# EAGLE design av-streamer-audio-hat (EAGLE 9.7.0)
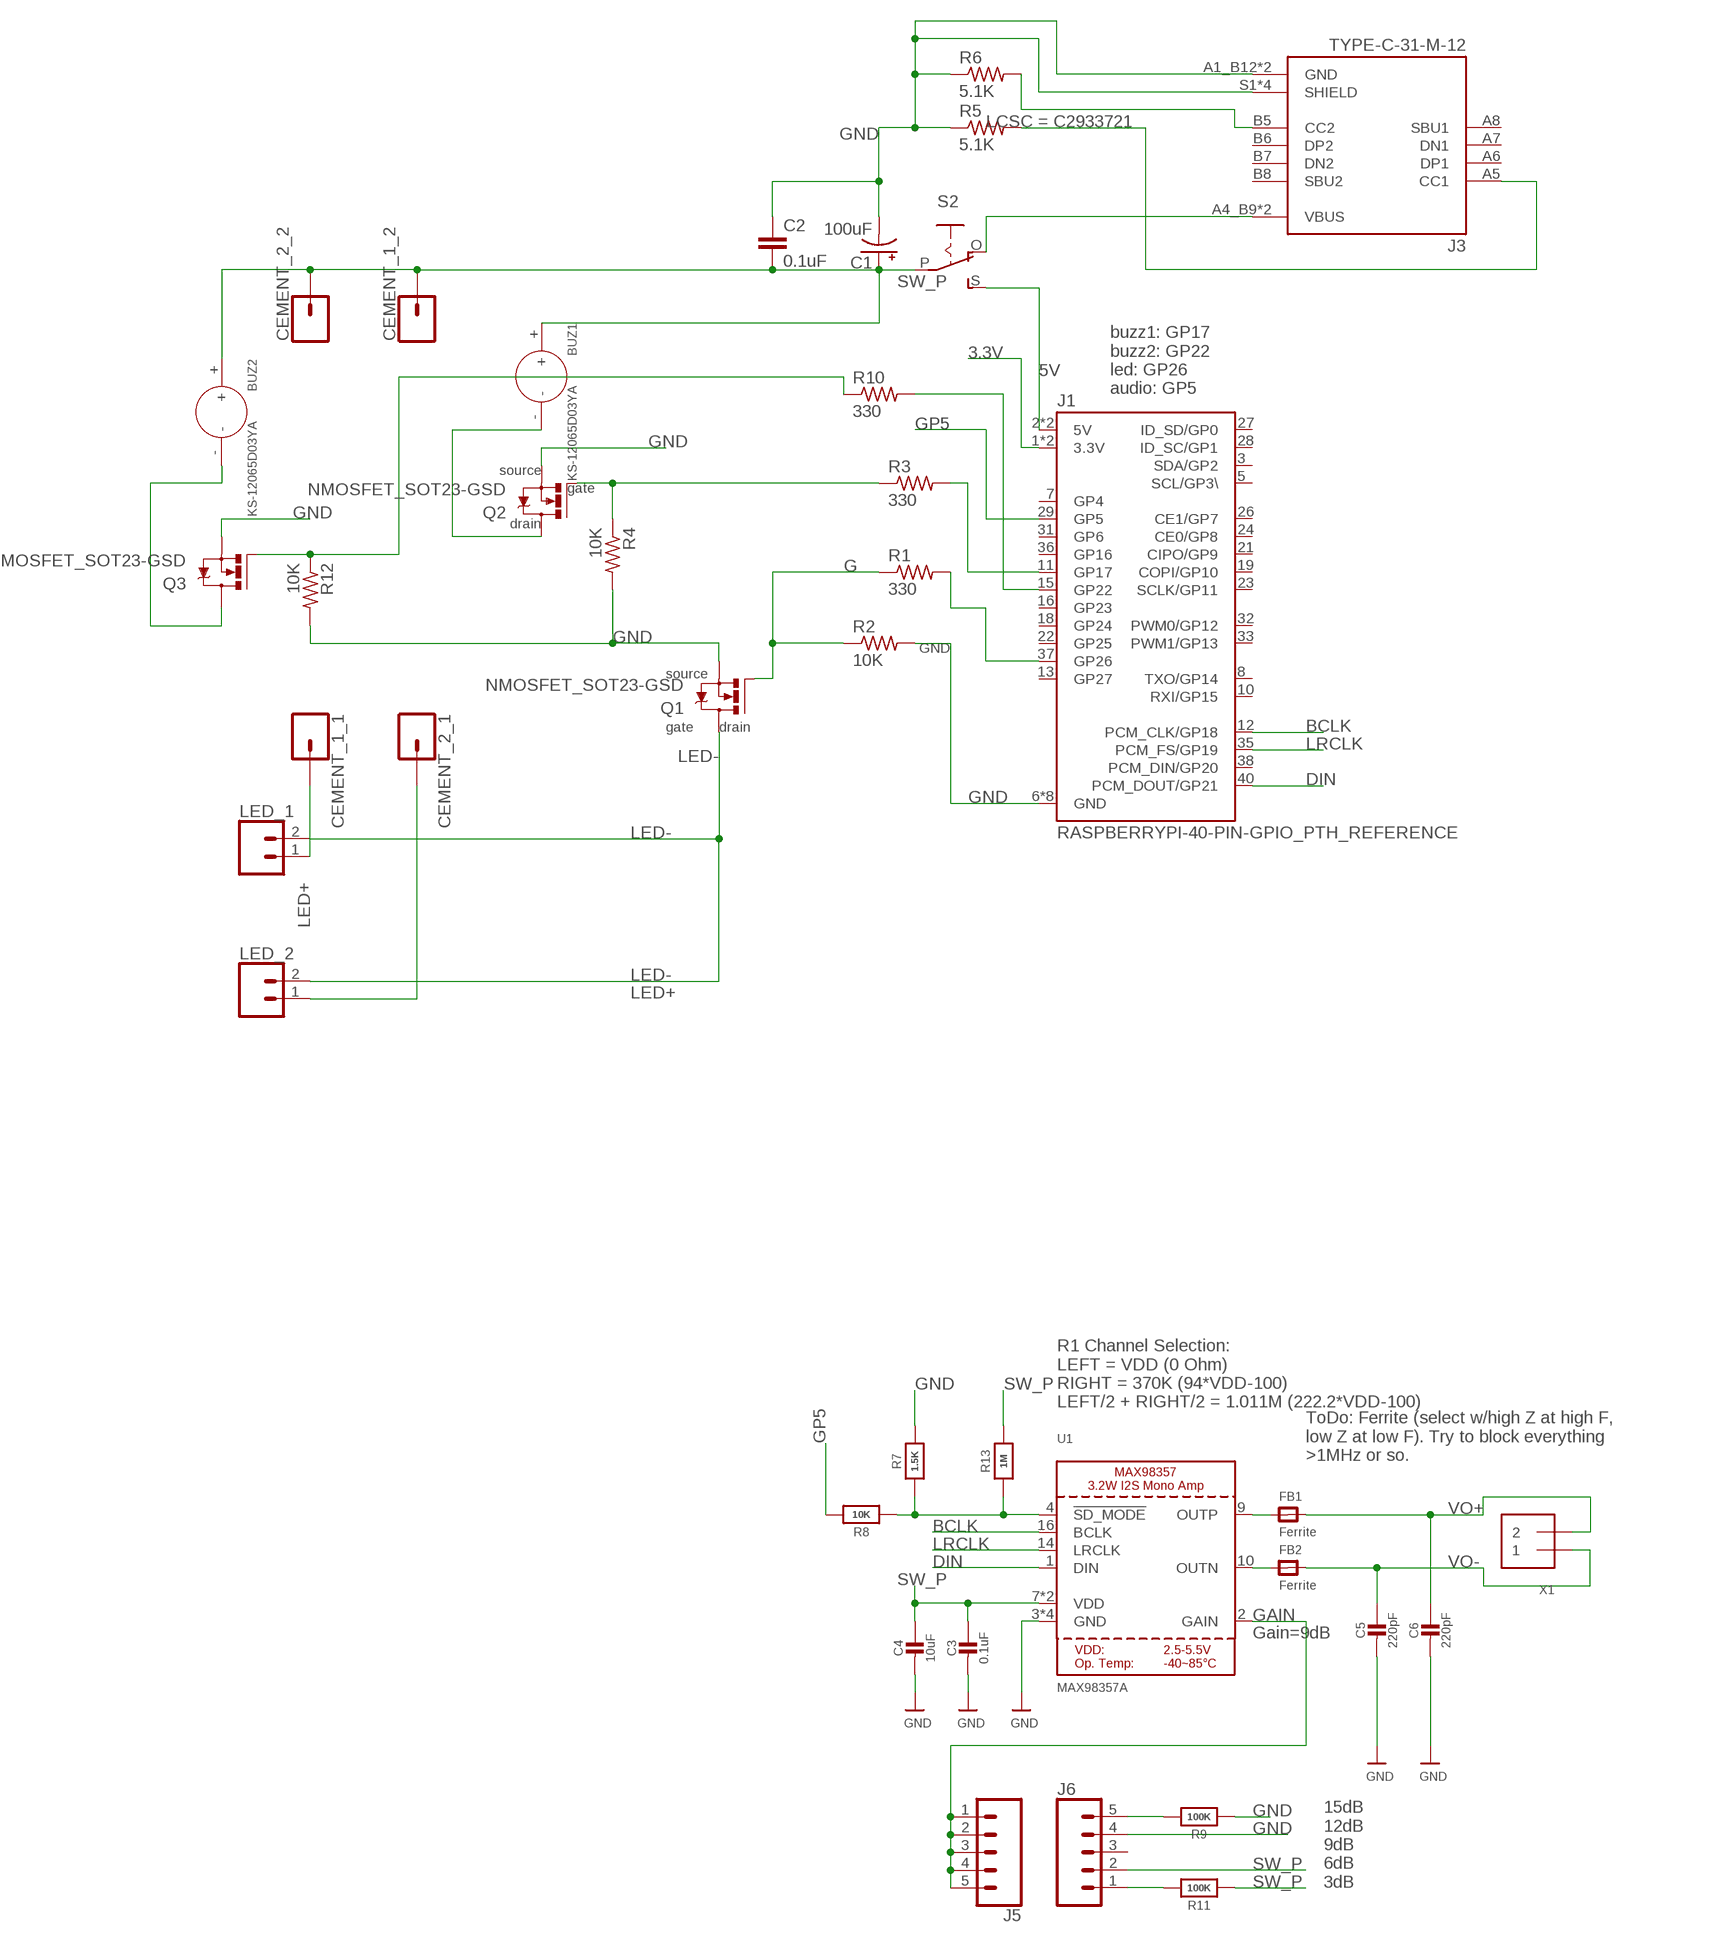
[diagram p0: schematic, sheet 1]

## Parts
BUZ1  KS-12065D03YA  DIP-BUZZER-3V(KS-12065D03YA)  [BZ2-7.6-D12.0XH6.5MM]
BUZ2  KS-12065D03YA  DIP-BUZZER-3V(KS-12065D03YA)  [BZ2-7.6-D12.0XH6.5MM]
C1  100uF  100UF-POLAR-EIA7343-10V-10%(TANT)  [EIA7343]
C2  0.1uF  0.1UF-0402-16V-10%  [0402]
C3  0.1uF  CAP_CERAMIC0805-NOOUTLINE  [0805-NO]
C4  10uF  CAP_CERAMIC0805-NOOUTLINE  [0805-NO]
C5  220pF  CAP_CERAMIC0805-NOOUTLINE  [0805-NO]
C6  220pF  CAP_CERAMIC0805-NOOUTLINE  [0805-NO]
CEMENT_1_1  CONN_01  [1X01]
CEMENT_1_2  CONN_01  [1X01]
CEMENT_2_1  CONN_01  [1X01]
CEMENT_2_2  CONN_01  [1X01]
FB1  Ferrite  FERRITE-0805NO  [0805-NO]
FB2  Ferrite  FERRITE-0805NO  [0805-NO]
J1  RASPBERRYPI-40-PIN-GPIO_PTH_REFERENCE  [RASPBERRY_PI_HAT_40_PIN_PTH_WITH_REFERNCE]
J3  TYPE-C-31-M-12  [HRO_TYPE-C-31-M-12]
J5  CONN_05PTH  [1X05]
J6  CONN_05PTH  [1X05]
LED_1  CONN_02  [1X02]
LED_2  CONN_02  [1X02]
Q1  NMOSFET_SOT23-GSD  [SOT23]
Q2  NMOSFET_SOT23-GSD  [SOT23]
Q3  NMOSFET_SOT23-GSD  [SOT23]
R1  330  R-US_R1206  [R1206]
R2  10K  R-US_R1206  [R1206]
R3  330  R-US_R1206  [R1206]
R4  10K  R-US_R1206  [R1206]
R5  5.1K  R-US_R1206  [R1206]
R6  5.1K  R-US_R1206  [R1206]
R7  1.5K  RESISTOR0805_NOOUTLINE  [0805-NO]
R8  10K  RESISTOR0805_NOOUTLINE  [0805-NO]
R9  100K  RESISTOR0805_NOOUTLINE  [0805-NO]
R10  330  R-US_R1206  [R1206]
R11  100K  RESISTOR0805_NOOUTLINE  [0805-NO]
R12  10K  R-US_R1206  [R1206]
R13  1M  RESISTOR0805_NOOUTLINE  [0805-NO]
S2  EG1218S  [EG1218]
U1  MAX98357A  AUDIOAMP_MAX98357  [QFN16_3MM]
X1  TERMBLOCK_1X2  [TERMBLOCK_1X2-3.5MM]

## Nets
3.3V: J1.1(3.3V) J1.17(3.3V)
5V [POWER]: J1.2(5V) J1.4(5V) S2.S
BCLK [SIG]: J1.12(PCM_CLK/GP18) U1.16(BCLK)
DIN [SIG]: J1.40(PCM_DOUT/GP21) U1.1(DIN)
G [LED]: Q1.1(G) R1.1 R2.1
GAIN [SIG]: J5.1 J5.2 J5.3 J5.4 J5.5 U1.2(GAIN)
GND: C1.C(-) C2.1 C3.2 C4.2 C5.2 C6.2 J1.6(GND) J1.9(GND) J1.14(GND) J1.20(GND) J1.25(GND) J1.30(GND) J1.34(GND) J1.39(GND) J3.A1_B12(GND) J3.B1_A12(GND) J3.S1(SHIELD) J3.S2(SHIELD) J3.S3(SHIELD) J3.S4(SHIELD) J6.4 Q1.2(S) Q2.2(S) Q3.2(S) R2.2 R4.2 R5.1 R6.1 R7.2 R9.1 R12.2 U1.3(GND) U1.11(GND) U1.15(GND) U1.THERMAL(GND)
GP5 [SIG]: J1.29(GP5) R8.2
GP16: J1.15(GP22) R10.2
LED+ [LED]: CEMENT_1_1.1 CEMENT_2_1.1 LED_1.1 LED_2.1
LED- [LED]: LED_1.2 LED_2.2 Q1.3(D)
LRCLK [SIG]: J1.35(PCM_FS/GP19) U1.14(LRCLK)
N$1: J1.11(GP17) R3.2
N$2: FB2.1 U1.10(OUTN)
N$3 [SIG]: J1.37(GP26) R1.2
N$4: Q2.1(G) R3.1 R4.1
N$5: J3.A5(CC1) R5.2
N$6: J3.B5(CC2) R6.2
N$7: J3.A4_B9(VBUS) J3.B4_A9(VBUS) S2.O
N$8: BUZ2.- Q3.3(D)
N$9 [POWER]: BUZ1.- Q2.3(D)
N$11: FB1.1 U1.9(OUTP)
N$12: Q3.1(G) R10.1 R12.1
N$13: J6.5 R9.2
N$14 [SIG]: R7.1 R8.1 R13.1 U1.4(!SD_MODE)
N$15: J6.1 R11.2
SW_P [POWER]: BUZ1.+ BUZ2.+ C1.A(+) C2.2 C3.1 C4.1 CEMENT_1_2.1 CEMENT_2_2.1 J6.2 R11.1 R13.2 S2.P U1.7(VDD) U1.8(VDD)
VO+: C6.1 FB1.2 X1.2
VO-: C5.1 FB2.2 X1.1
Unconnected: J1.3(SDA/GP2) J1.5(SCL/GP3\) J1.7(GP4) J1.8(TXO/GP14) J1.10(RXI/GP15) J1.13(GP27) J1.16(GP23) J1.18(GP24) J1.19(COPI/GP10) J1.21(CIPO/GP9) J1.22(GP25) J1.23(SCLK/GP11) J1.24(CE0/GP8) J1.26(CE1/GP7) J1.27(ID_SD/GP0) J1.28(ID_SC/GP1) J1.31(GP6) J1.32(PWM0/GP12) J1.33(PWM1/GP13) J1.36(GP16) J1.38(PCM_DIN/GP20) J3.A6(DP1) J3.A7(DN1) J3.A8(SBU1) J3.B6(DP2) J3.B7(DN2) J3.B8(SBU2) J6.3

## Notes on the sheet
- buzz1: GP17
  buzz2: GP22
  led: GP26
  audio: GP5
- source
- gate
- drain
- source
- gate | drain
- R1 Channel Selection:
  LEFT = VDD (0 Ohm)
  RIGHT = 370K (94*VDD-100)
  LEFT/2 + RIGHT/2 = 1.011M (222.2*VDD-100)
- ToDo: Ferrite (select w/high Z at high F,
  low Z at low F). Try to block everything
  >1MHz or so.
- Gain=9dB
- 15dB
  12dB
  9dB
  6dB
  3dB

## Library data of the parts
BUZ1 BUZ2 = OPL_Connector:DIP-BUZZER-3V(KS-12065D03YA): 312010004; MPN: KS-12065D03YA
C1 = SparkFun-Capacitors:100UF-POLAR: 100µF polarized capacitors A capacitor is a passive two-terminal electrical component used to store electrical energy temporarily in an electric field.; PROD_ID: CAP-07890
C2 = SparkFun-Capacitors:0.1UF: 0.1µF ceramic capacitors A capacitor is a passive two-terminal electrical component used to store electrical energy temporarily in an electric field.; PROD_ID: CAP-12416
C3-C6 = microbuilder:CAP_CERAMIC: Ceramic Capacitors For new designs, use the packages preceded by an '_' character since they are more reliable: The following footprints should be used on most boards: _0402 - Standard footprint for regular board layouts _0603 - Standard footprint for regular board layouts _0805 - Standard footprint for regular board layouts _1206 - Standard footprint for regular board layouts For extremely tight-pitch boards where space is at a premium, the following 'micro-pitch' footprints can be used (smaller pads, no silkscreen outline, etc.): _0402MP - Micro-pitch footprint for very dense/compact boards _0603MP - Micro-pitch footprint for very dense/compact boards _0805MP - Micro-pitch footprint for very dense/compact boards _1206MP - Micro-pitch footprint for very dense/compact boards
CEMENT_1_1 CEMENT_1_2 CEMENT_2_1 CEMENT_2_2 = SparkFun-Connectors:CONN_01: Single connection point. Often used as Generic Header-pin footprint for 0.1 inch spaced/style header connections On any of the 0.1 inch spaced packages, you can populate with these: Break Away Headers - Straight <https://www.sparkfun.com/products/116> (PRT-00116) Break Away Male Headers - Right Angle <https://www.sparkfun.com/products/553> (PRT-00553) Female Headers <https://www.sparkfun.com/products/115> (PRT-00115) Break Away Headers - Machine Pin <https://www.sparkfun.com/products/117> (PRT-00117) Break Away Female Headers - Swiss Machine Pin <https://www.sparkfun.com/products/743> (PRT-00743) This device is also useful as a general connection point to wire up your design to another part of your project. Our various solder wires solder well into these plated through hole pads. Hook-Up Wire - Assortment (Stranded, 22 AWG) <https://www.sparkfun.com/products/11375> (PRT-11375) Hook-Up Wire - Assortment (Solid Core, 22 AWG) <https://www.sparkfun.com/products/11367> (PRT-11367) View the entire wire category on our website here <https://www.sparkfun.com/categories/141> Special notes: SMTSO-256-ET is a "flush mount" nut for a 4-40 screw. We mostly use this on specialty testbeds; it is a nice way to connect hardware to your PCB at an adjustable hieght. Also note, the SNAP packages are for using a snappable style connector. We sell a baggie of snaps and they are also used on two LilyPad designs: Snap Assortment - 30 pack (male and female) <https://www.sparkfun.com/products/11347> (DEV-11347) LilyPad Arduino SimpleSnap <https://www.sparkfun.com/products/10941> (DEV-10941) LilyPad SimpleSnap Protoboard <https://www.sparkfun.com/products/10940> (DEV-10940)
FB1 FB2 = microbuilder:FERRITE: Ferrite Bead 0603 MMZ1608B121C - 120 Ohm @ 100MHz, 600mA, 0.15 Ohm DC Resistance - Digikey: 445-2164-1-ND BK1608HW121-T - 120 Ohm, 600mA Ferrite Chip - Digikey: 587-1876-2-ND 0805 HZ0805B272R-10 - 2.7K Ohm @ 100MHz, 200mA, 0.8 Ohm DC Resistance - Digikey: 240-2504-1-ND (see also Murata BLM21BD272SN1L) MMZ2012Y152B - 1.5K Ohm @ 100MHz, 500mA, 0.4 Ohm DC Resistance - Digikey: 445-1560-1-ND - Mainly for high frequency (80-400MHz) MMZ2012R102A - 1K Ohm @ 100MHz, 500mA, 0.3 Ohm DC Resistance - Digikey: 445-1555-2-ND - More general purpose (10-200MHz)
J1 = SparkFun-Connectors:RASPBERRYPI-40-PIN-GPIO: Raspberry Pi GPIO Header 2x20 pin connector, as found on B, B+, A+ models. Both shrouded PTH and SMT versions available. SparkFun Products: GPIO Shrouded Header <https://www.sparkfun.com/products/13054>- PTH SparkFun Pi Wedge (Preassembled) <https://www.sparkfun.com/products/13717>
J3 = TYPE-C-31-M-12:TYPE-C-31-M-12: Check availability <https://pricing.snapeda.com/parts/TYPE-C-31-M-12/HRO%20Electronics%20Co.%2C%20Ltd./view-part?ref=eda>; AVAILABILITY: Not in stock; CHECK_PRICES: https://www.snapeda.com/parts/TYPE-C-31-M-12/HRO+Electronics+Co.%252C+Ltd./view-part/?ref=eda; DESCRIPTION: USB Connectors 24 Receptacle 1 8.94*7.3mm RoHS; MF: HRO Electronics Co., Ltd.; MP: TYPE-C-31-M-12; PACKAGE: Package; PRICE: None; SNAPEDA_LINK: https://www.snapeda.com/parts/TYPE-C-31-M-12/HRO+Electronics+Co.%252C+Ltd./view-part/?ref=snap
J5 J6 = SparkFun-Connectors:CONN_05: Multi connection point. Often used as Generic Header-pin footprint for 0.1 inch spaced/style header connections On any of the 0.1 inch spaced packages, you can populate with these: Break Away Headers - Straight <https://www.sparkfun.com/products/116> (PRT-00116) Break Away Male Headers - Right Angle <https://www.sparkfun.com/products/553> (PRT-00553) Female Headers <https://www.sparkfun.com/products/115> (PRT-00115) Break Away Headers - Machine Pin <https://www.sparkfun.com/products/117> (PRT-00117) Break Away Female Headers - Swiss Machine Pin <https://www.sparkfun.com/products/743> (PRT-00743) For SCREWTERMINALS and SPRING TERMINALS visit here: Screw Terimnals on SparkFun.com <https://www.sparkfun.com/search/results?term=Screw+Terminals> (5mm/3.5mm/2.54mm spacing) This device is also useful as a general connection point to wire up your design to another part of your project. Our various solder wires solder well into these plated through hole pads. Hook-Up Wire - Assortment (Stranded, 22 AWG) <https://www.sparkfun.com/products/11375> (PRT-11375) Hook-Up Wire - Assortment (Solid Core, 22 AWG) <https://www.sparkfun.com/products/11367> (PRT-11367) View the entire wire category on our website here <https://www.sparkfun.com/categories/141> Special notes: Molex polarized connector foot print use with SKU : PRT-08231 with associated crimp pins and housings. 1MM SMD Version SKU: PRT-10208
LED_1 LED_2 = SparkFun-Connectors:CONN_02: Multi connection point. Often used as Generic Header-pin footprint for 0.1 inch spaced/style header connections On any of the 0.1 inch spaced packages, you can populate with these: Break Away Headers - Straight <https://www.sparkfun.com/products/116> (PRT-00116) Break Away Male Headers - Right Angle <https://www.sparkfun.com/products/553> (PRT-00553) Female Headers <https://www.sparkfun.com/products/115> (PRT-00115) Break Away Headers - Machine Pin <https://www.sparkfun.com/products/117> (PRT-00117) Break Away Female Headers - Swiss Machine Pin <https://www.sparkfun.com/products/743> (PRT-00743) For SCREWTERMINALS and SPRING TERMINALS visit here: Screw Terimnals on SparkFun.com <https://www.sparkfun.com/search/results?term=Screw+Terminals> (5mm/3.5mm/2.54mm spacing) This device is also useful as a general connection point to wire up your design to another part of your project. Our various solder wires solder well into these plated through hole pads. Hook-Up Wire - Assortment (Stranded, 22 AWG) <https://www.sparkfun.com/products/11375> (PRT-11375) Hook-Up Wire - Assortment (Solid Core, 22 AWG) <https://www.sparkfun.com/products/11367> (PRT-11367) View the entire wire category on our website here <https://www.sparkfun.com/categories/141> Special notes: Molex polarized connector foot print use with: PRT-08233 with associated crimp pins and housings. 2.54_SCREWTERM for use with PRT-10571. 3.5mm Screw Terminal footprints for PRT-08084 5mm Screw Terminal footprints for use with PRT-08432
Q1 = Transistor:NMOSFET: N-Channel MOSFET - Generic; CATEGORY: Transistor; DATASHEET: https://www.analog.com/media/en/package-pcb-resources/package/pkg_pdf/ltc-legacy-sot-23/sot3%2005-08-1631%20rev%20d.pdf; DESCRIPTION: Generic N Channel MOSFET SOT23-GSD Package Surface Mount; LCSC: C181090; PACKAGE_SIZE: SOT23; PACKAGE_TYPE: Surface Mount; SUBCATEGORY: MOSFET; TYPE: N-Channel
Q2 Q3 = Transistor:NMOSFET: N-Channel MOSFET - Generic; CATEGORY: Transistor; DATASHEET: https://www.analog.com/media/en/package-pcb-resources/package/pkg_pdf/ltc-legacy-sot-23/sot3%2005-08-1631%20rev%20d.pdf; DESCRIPTION: Generic N Channel MOSFET SOT23-GSD Package Surface Mount; PACKAGE_SIZE: SOT23; PACKAGE_TYPE: Surface Mount; SUBCATEGORY: MOSFET; TYPE: N-Channel
R1-R4 R10 R12 = adafruit:R-US_: RESISTOR, American symbol
R5 R6 = adafruit:R-US_: RESISTOR, American symbol; LCSC: C2933721
R7-R9 R11 R13 = microbuilder:RESISTOR: Resistors For new designs, use the packages preceded by an '_' character since they are more reliable: The following footprints should be used on most boards: _0402 - Standard footprint for regular board layouts _0603 - Standard footprint for regular board layouts _0805 - Standard footprint for regular board layouts _1206 - Standard footprint for regular board layouts For extremely tight-pitch boards where space is at a premium, the following 'micro-pitch' footprints can be used (smaller pads, no silkscreen outline, etc.): _0402MP - Micro-pitch footprint for very dense/compact boards _0603MP - Micro-pitch footprint for very dense/compact boards _0805MP - Micro-pitch footprint for very dense/compact boards _1206MP - Micro-pitch footprint for very dense/compact boards
S2 = adafruit:EG1218: SLIDING SWITCH 0.1" spacing through hole, vertical SPDT slide switch http://www.ladyada.net/library/pcb/eaglelibrary.html
U1 = microbuilder:AUDIOAMP_MAX98357: MAX98357 - 3.2W I2S Mono Audio Amp
X1 = microbuilder:TERMBLOCK_1X2: 3.5mm Terminal block http://www.ladyada.net/library/pcb/eaglelibrary.html

## Net classes
1 POWER: width 1 mm, clearance 0.3 mm
2 LED: width 1 mm, clearance 0.3 mm
3 SIG: width 0.254 mm

## Board
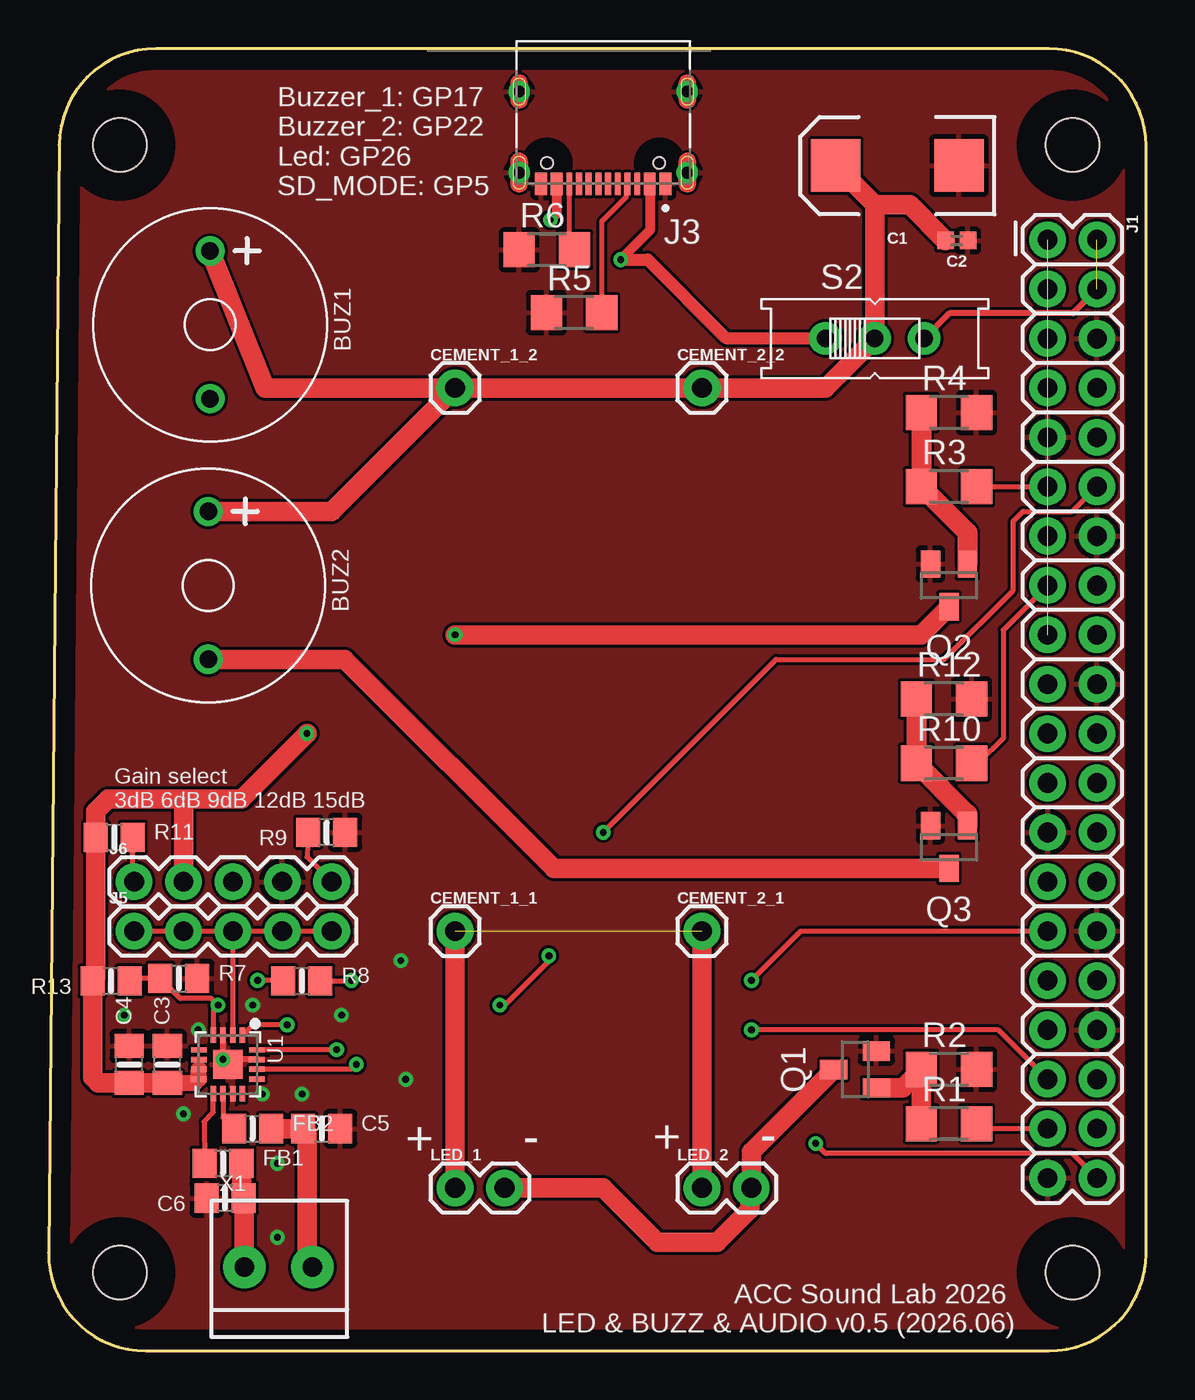
[diagram p1: board, top side]
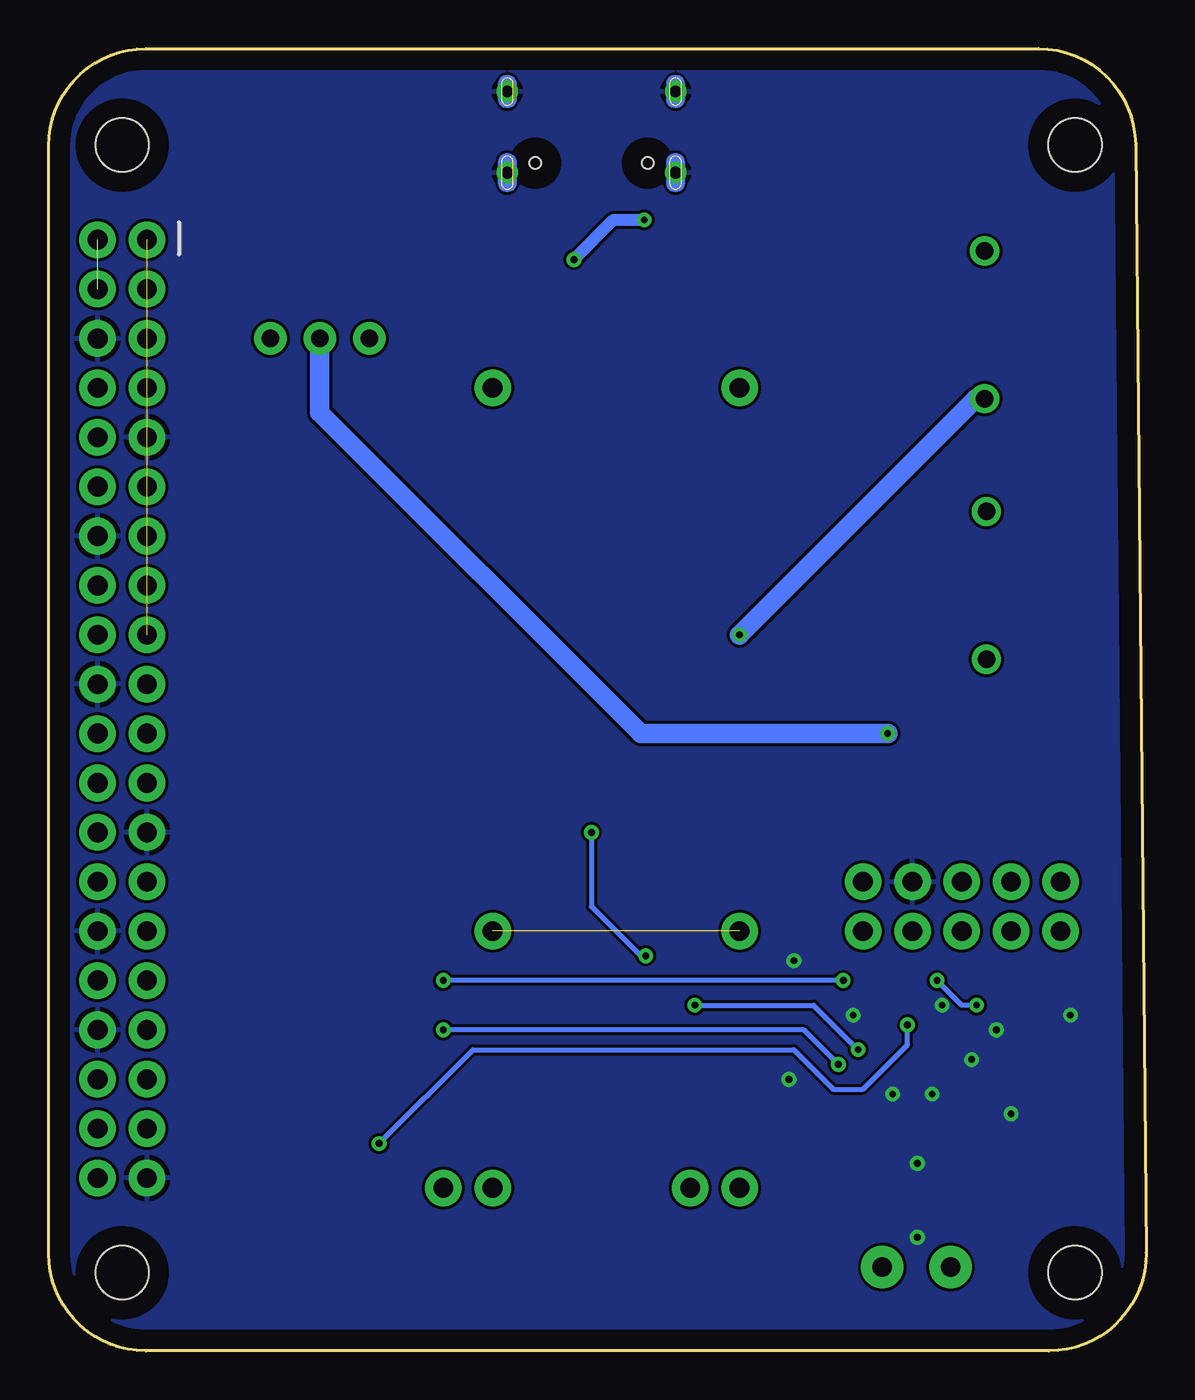
[diagram p2: board, bottom side, seen from below]

Size 56.45 x 66.98 mm. Coordinates in mm from the lower left corner, seen from the top.
Outline: 51.45,0 arc90 56.45,5 56.45,61.98 arc90 51.45,66.98 5.54,66.98 arc89 0.54,62.03 0,5.05 arc91 5,0 51.45,0
Copper layers (1*16): Top 0.035mm / dielectric 1.5mm / Bottom 0.035mm
Design rules "Fusion Electronics Design Rules": minimum track width 6mil, minimum drill 0.35mm, track to track 6mil, track to pad 6mil, pad to pad 6mil, via to via 6mil, smd to smd 6mil, copper to edge 40mil, drill to drill 6mil, minimum pad ring 10mil, minimum via ring 8mil, stop-mask expansion 4mil, vias tented up to drill 9999mil, thermal gap 10mil

### Footprints (pad centres in the part's own frame; a part is rotated, then mirrored left to right if it is on the bottom)
BZ2-7.6-D12.0XH6.5MM = drill 0.9 pad 1.5: + -3.8,0; - 3.8,0
EIA7343 = smd 2.55 x 2.7: A 3.17,0; C -3.17,0
0402 = smd 0.85 x 0.9: 1 -0.58,0; 2 0.58,0
0805-NO = smd 1.24 x 1.5: 1 -0.95,0; 2 0.95,0
1X01 = drill 1.016 pad 1.88: 1 0,0
RASPBERRY_PI_HAT_40_PIN_PTH_WITH_REFERNCE = drill 1.016 pad 1.88: 1 0,0; 2 0,2.54; 3 2.54,0; 4 2.54,2.54; 5 5.08,0; 6 5.08,2.54; 7 7.62,0; 8 7.62,2.54; 9 10.16,0; 10 10.16,2.54; 11 12.7,0; 12 12.7,2.54; 13 15.24,0; 14 15.24,2.54; 15 17.78,0; 16 17.78,2.54; 17 20.32,0; 18 20.32,2.54; 19 22.86,0; 20 22.86,2.54; 21 25.4,0; 22 25.4,2.54; 23 27.94,0; 24 27.94,2.54; 25 30.48,0; 26 30.48,2.54; 27 33.02,0; 28 33.02,2.54; 29 35.56,0; 30 35.56,2.54; 31 38.1,0; 32 38.1,2.54; 33 40.64,0; 34 40.64,2.54; 35 43.18,0; 36 43.18,2.54; 37 45.72,0; 38 45.72,2.54; 39 48.26,0; 40 48.26,2.54 | hole 2.75: -4.87,-47.727; 53.13,-47.727; 53.13,1.273; -4.87,1.273
HRO_TYPE-C-31-M-12 = smd 0.6 x 1.14: A1_B12 -3.2,4.75; A4_B9 -2.4,4.75; B1_A12 3.2,4.75; B4_A9 2.4,4.75 | smd 0.3 x 1.14: A5 -1.25,4.75; A6 -0.25,4.75; A7 0.25,4.75; A8 1.25,4.75; B5 1.75,4.75; B6 0.75,4.75; B7 -0.75,4.75; B8 -1.75,4.75 | drill 0.6 pad 0.9: S1 -4.325,4.17; S2 4.325,4.17; S3 -4.325,0; S4 4.325,0 | hole 0.6: -2.89,3.68; 2.89,3.68
1X05 = drill 1.016 pad 1.88: 1 0,0; 2 2.54,0; 3 5.08,0; 4 7.62,0; 5 10.16,0
1X02 = drill 1.016 pad 1.88: 1 0,0; 2 2.54,0
SOT23 = smd 1 x 1.4: 1 -0.95,-1.1; 2 0.95,-1.1; 3 0,1.1
R1206 = smd 1.6 x 1.803: 1 -1.422,0; 2 1.422,0
EG1218 = drill 0.9 pad 1.676: O -2.54,0; P 0,0; S 2.54,0
QFN16_3MM = smd 0.8 x 0.28: 1 -1.5,0.75; 2 -1.5,0.25; 3 -1.5,-0.25; 4 -1.5,-0.75; 9 1.5,-0.75; 10 1.5,-0.25; 11 1.5,0.25; 12 1.5,0.75 | smd 0.28 x 0.8: 5 -0.75,-1.5; 6 -0.25,-1.5; 7 0.25,-1.5; 8 0.75,-1.5; 13 0.75,1.5; 14 0.25,1.5; 15 -0.25,1.5; 16 -0.75,1.5 | smd 1.5 x 1.5: THERMAL 0,0
TERMBLOCK_1X2-3.5MM = drill 1 pad 2.184: 1 1.8,0; 2 -1.7,0

### Placement (x,y rotation side)
BUZ1  8.31,52.77 270 top
BUZ2  8.21,39.37 270 top
C1  43.66,60.96 180 top
C2  46.71,57.11 180 top
C3  6.11,14.73 90 top
C4  4.14,14.73 90 top
C5  14.05,11.43 0 top
C6  9.08,7.86 180 top
CEMENT_1_1  20.91,21.59 0 top
CEMENT_1_2  20.91,49.53 0 top
CEMENT_2_1  33.61,21.59 0 top
CEMENT_2_2  33.61,49.53 0 top
FB1  8.97,9.65 0 top
FB2  10.49,11.43 0 top
J1  51.39,57.15 270 top
J3  28.53,64.77 180 top
J5  4.4,21.59 0 top
J6  4.4,24.13 0 top
LED_1  20.91,8.38 0 top
LED_2  33.61,8.38 0 top
Q1  41.48,14.48 90 top
Q2  46.31,39.37 180 top
Q3  46.31,25.91 180 top
R1  46.31,11.68 0 top
R2  46.31,14.48 0 top
R3  46.31,44.45 0 top
R4  46.31,48.26 0 top
R5  27.03,53.4 0 top
R6  25.63,56.63 0 top
R7  6.7,19.16 0 top
R8  13.02,19.03 0 top
R9  14.3,26.67 180 top
R10  46.05,30.23 0 top
R11  3.38,26.42 0 top
R12  46.05,33.53 0 top
R13  3.21,19.03 180 top
S2  42.5,52.07 0 top
U1  9.22,14.73 270 top
X1  11.76,4.32 0 top

### Tracks (layer width: path | path; a pad name or v marks a point on that pad's centre or on a via)
3.3V  (1 unrouted)
5V  (1 unrouted)
  Top 0.305: J1.4 52.68,53.36 46.33,53.36 S2.S
BCLK  (via drill 0.35)
  Top 0.152: v14.8,15.48 v14.81,15.49
  Top 0.254: v14.8,15.48 U1.16 | v25.73,20.32 25.73,20.05 23.46,17.78 v23.21,17.78 | v28.53,26.67 37.42,35.56 46.05,35.56 49.61,39.12 49.61,42.67 50.12,43.18 52.66,43.18 J1.12
  Bottom 0.254: 14.94,15.62 v14.81,15.49 17.1,17.78 v23.21,17.78 | v28.53,26.67 28.53,22.86 25.99,20.32 v25.73,20.32
DIN  (via drill 0.35)
  Top 0.254: J1.40 52.66,10.16 39.96,10.16 v39.45,10.67 | U1.1 10.51,16.76 v12.27,16.76
  Bottom 0.254: v39.45,10.67 34.62,15.49 18.11,15.49 16.08,13.46 14.56,13.46 12.27,15.75 v12.27,16.76
G
  Top 1: R1.1 R2.1 43.94,13.53 Q1.1
GAIN
  Top 0.254: J5.1 J5.2 J5.3 | J5.3 J5.4 J5.5 | U1.2 J5.3
GND  (via drill 0.35)
  Top 0.152: 9.47,14.98 U1.THERMAL v8.97,14.98
  Top 0.305: U1.15 9.47,14.98 | v8.97,14.98 U1.3
  other vias: 7.7,16.51 10.49,17.78 3.89,17.27 11.76,5.84 11,13.21 13.03,13.21 11.76,9.65 6.94,12.19 18.37,13.97 15.07,17.27 18.11,20.07
  pour Top: -6.96,-3.73 69.09,-3.73 69.09,69.77 -6.96,69.77
  pour Bottom: 76.8,-11.35 76.83,-11.37 79.25,-13.79 79.25,72.41 79.26,72.43 81.68,74.85 -7,74.85 -9.5,72.36 -9.5,-11.35
GP5  (via drill 0.35)
  Top 0.152: 15.55,19.03 v15.57,19.05
  Top 0.254: R8.2 15.55,19.03 | v36.15,19.05 38.69,21.59 J1.29
  Bottom 0.254: v15.57,19.05 v36.15,19.05
GP16
  Top 0.254: J1.15 49.1,37.08 49.1,31.5 47.83,30.23 R10.2
LED+  (1 unrouted)
  Top 1: CEMENT_1_1.1 LED_1.1 | CEMENT_2_1.1 LED_2.1
LED-
  Top 1: Q1.3 36.15,10.24 LED_2.2 36.07,8.38 36.07,7.29 34.37,5.59 31.32,5.59 28.53,8.38 LED_1.2
LRCLK  (via drill 0.35)
  Top 0.254: J1.35 48.85,16.51 v36.15,16.51 | U1.14 15.58,14.48 v15.83,14.73
  Bottom 0.254: v36.15,16.51 17.61,16.51 v15.83,14.73
N$1
  Top 0.25: R3.2 J1.11
N$2
  Top 0.254: U1.10 8.97,12 FB2.1
N$3
  Top 0.152: 47.98,11.43 R1.2
  Top 0.254: J1.37 47.98,11.43
N$4
  Top 1.016: R4.1 R3.1 47.26,42.08 Q2.1
N$5
  Top 0.25: J3.A5 29.7,59.95 29.7,59.33 28.45,58.08 R5.2
N$6
  Top 0.25: J3.B5 26.78,56.9 R6.2
N$7  (via drill 0.35)
  Top 0.508: J3.B4_A9 26.13,58.49 v25.81,58.17 | J3.A4_B9 30.93,57.63 v29.43,56.13
  Top 0.61: S2.O 34.88,52.07 30.82,56.13 v29.43,56.13
  Bottom 0.61: v29.43,56.13 27.39,58.17 v25.81,58.17
N$8
  Top 1: Q3.3 25.99,24.81 15.23,35.57 BUZ2.-
N$9  (via drill 0.35)
  Top 1: Q2.3 44.87,36.83 v20.91,36.83
  Bottom 1: v20.91,36.83 8.77,48.97 BUZ1.-
N$11
  Top 0.254: U1.9 8.47,12.27 7.99,11.79 FB1.1
N$12
  Top 1.016: R12.1 R10.1 47.26,27.6 Q3.1
N$13
  Top 0.254: R9.2 13.29,25.4 J6.5
N$14  (via drill 0.35)
  Top 0.152: 5.76,19.14 R7.1 | R8.1 12.05,19.05
  Top 0.254: 12.05,19.05 v10.75,19.05 | U1.4 8.47,17.54 v8.72,17.78 8.37,18.13 6.78,18.13 5.76,19.14 | R7.1 5.67,19.16 4.3,19.16 R13.1
  Bottom 0.254: v10.75,19.05 9.48,17.78 v8.72,17.78
N$15
  Top 0.152: J6.1 4.33,24.2
  Top 0.254: 4.33,24.2 R11.2
SW_P  (via drill 0.35)
  Top 0.813: U1.7 U1.8 7.52,13.78 C3.1
  Top 1: CEMENT_1_2.1 CEMENT_2_2.1 39.96,49.53 S2.P 42.5,58.95 | CEMENT_1_2.1 11.13,49.53 BUZ1.+ | 42.5,58.95 C1.A | 42.5,58.95 44.29,58.95 C2.2 | BUZ2.+ 14.55,43.17 CEMENT_1_2.1 | C3.1 C4.1 2.55,13.78 2.27,14.07 R13.2 2.43,19.19 R11.1 2.43,27.75 3.06,28.38 6.94,28.38 | 6.94,28.38 9.92,28.38 v13.29,31.75 | J6.2 6.94,28.38
  Bottom 1: v13.29,31.75 25.99,31.75 42.5,48.26 S2.P
VO+
  Top 1: FB1.2 9.92,7.97 C6.1 10.06,7.82 X1.2
VO-
  Top 0.152: 13.56,10.97 13.29,11.24 13.19,11.34 C5.1 | 13.29,4.59 X1.1
  Top 1: 13.29,11.24 13.29,4.59 | C5.1 FB2.2

### Text on the board
tPlace: Buzzer_1: GP17 / Buzzer_2: GP22 / Led: GP26 / SD_MODE: GP5 | Gain select / 3dB 6dB 9dB 12dB 15dB | - | - | + | + | ACC Sound Lab 2026 | LED & BUZZ & AUDIO v0.5 (2026.06)